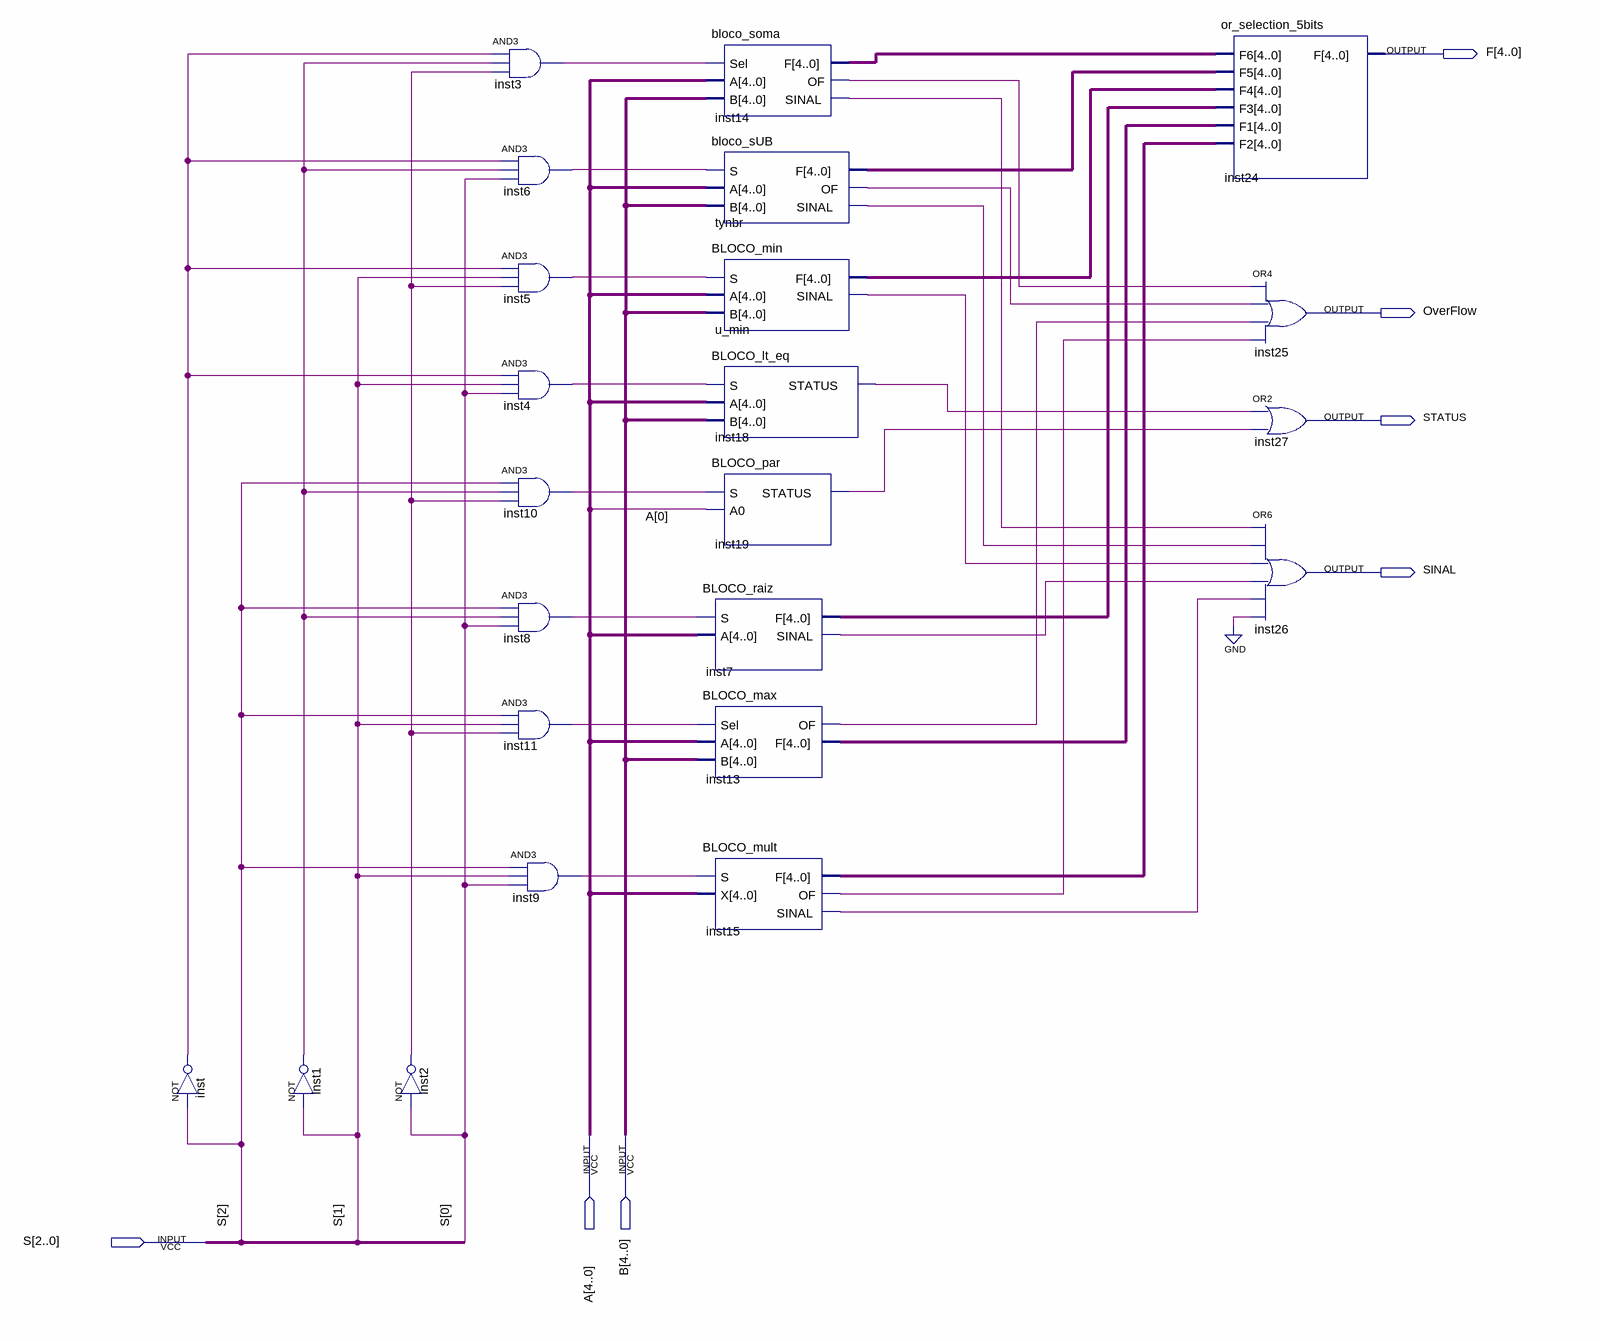
[diagram p0: schematic sheet]
// Quartus schematic ula.bdf as structural Verilog: 23 symbols, 7 pins
module ula (
  input  [4:0] A,
  input  [4:0] B,
  input  [2:0] S,
  output [4:0] F,
  output OverFlow,
  output STATUS,
  output SINAL
);

  wire inst1_out, inst2_out, inst3_out, inst4_out, inst5_out, inst6_out, inst7_sinal, inst8_out, inst9_out,
       inst10_out, inst11_out, inst13_of, inst14_of, inst14_sinal, inst15_of, inst15_sinal, inst18_status,
       inst19_status, inst_out, tynbr_of, tynbr_sinal, u_min_sinal;
  wire [4:0] inst7_f, inst13_f, inst14_f, inst15_f, tynbr_f, u_min_f;

  not inst (inst_out, S[2]);
  not inst1 (inst1_out, S[1]);
  not inst2 (inst2_out, S[0]);
  and inst3 (inst3_out, inst_out, inst1_out, inst2_out);
  and inst6 (inst6_out, inst_out, inst1_out, S[0]);
  and inst5 (inst5_out, inst_out, S[1], inst2_out);
  and inst4 (inst4_out, inst_out, S[1], S[0]);
  and inst10 (inst10_out, S[2], inst1_out, inst2_out);
  and inst8 (inst8_out, S[2], inst1_out, S[0]);
  and inst11 (inst11_out, S[2], S[1], inst2_out);
  and inst9 (inst9_out, S[2], S[1], S[0]);
  bloco_soma inst14 (.Sel(inst3_out), .A(A), .B(B), .F(inst14_f), .OF(inst14_of), .SINAL(inst14_sinal));
  bloco_sUB tynbr (.S(inst6_out), .A(A), .B(B), .F(tynbr_f), .OF(tynbr_of), .SINAL(tynbr_sinal));
  BLOCO_min u_min (.S(inst5_out), .A(A), .B(B), .F(u_min_f), .SINAL(u_min_sinal));
  BLOCO_lt_eq inst18 (.S(inst4_out), .A(A), .B(B), .STATUS(inst18_status));
  BLOCO_par inst19 (.S(inst10_out), .A0(A[0]), .STATUS(inst19_status));
  BLOCO_raiz inst7 (.S(inst8_out), .A(A), .F(inst7_f), .SINAL(inst7_sinal));
  BLOCO_max inst13 (.Sel(inst11_out), .A(A), .B(B), .OF(inst13_of), .F(inst13_f));
  BLOCO_mult inst15 (.S(inst9_out), .X(A), .F(inst15_f), .OF(inst15_of), .SINAL(inst15_sinal));
  or_selection_5bits inst24 (
    .F6(inst14_f), .F5(tynbr_f), .F4(u_min_f), .F3(inst7_f), .F1(inst13_f), .F2(inst15_f), .F(F));
  or inst25 (OverFlow, inst14_of, tynbr_of, inst13_of, inst15_of);
  or inst27 (STATUS, inst18_status, inst19_status);
  or inst26 (SINAL, inst14_sinal, tynbr_sinal, u_min_sinal, inst7_sinal, inst15_sinal, 1'b0);
endmodule
